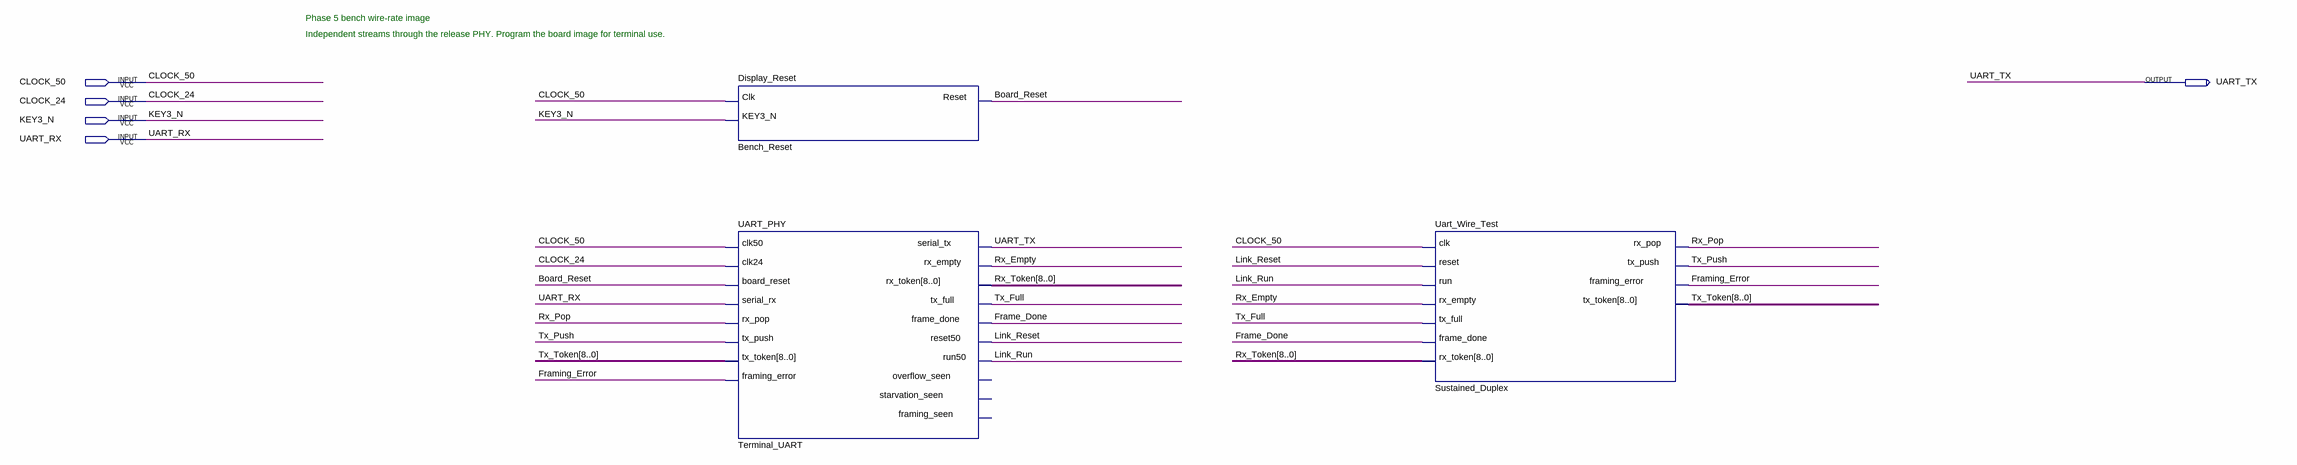
[diagram p0: schematic sheet]
// Quartus schematic Phase5_Wire_Test.bdf as structural Verilog: 3 symbols, 5 pins
module Phase5_Wire_Test (
  input  CLOCK_50,
  input  CLOCK_24,
  input  KEY3_N,
  input  UART_RX,
  output UART_TX
);

  wire Board_Reset, Frame_Done, Framing_Error, Link_Reset, Link_Run, Rx_Empty, Rx_Pop, Tx_Full, Tx_Push;
  wire [8:0] Rx_Token, Tx_Token;

  Display_Reset Bench_Reset (.Clk(CLOCK_50), .KEY3_N(KEY3_N), .Reset(Board_Reset));
  UART_PHY Terminal_UART (
    .clk50(CLOCK_50), .clk24(CLOCK_24), .board_reset(Board_Reset), .serial_rx(UART_RX), .rx_pop(Rx_Pop),
    .tx_push(Tx_Push), .tx_token(Tx_Token), .framing_error(Framing_Error), .serial_tx(UART_TX),
    .rx_empty(Rx_Empty), .rx_token(Rx_Token), .tx_full(Tx_Full), .frame_done(Frame_Done),
    .reset50(Link_Reset), .run50(Link_Run));  // open: overflow_seen, starvation_seen, framing_seen
  Uart_Wire_Test Sustained_Duplex (
    .clk(CLOCK_50), .reset(Link_Reset), .run(Link_Run), .rx_empty(Rx_Empty), .tx_full(Tx_Full),
    .frame_done(Frame_Done), .rx_token(Rx_Token), .rx_pop(Rx_Pop), .tx_push(Tx_Push),
    .framing_error(Framing_Error), .tx_token(Tx_Token));

  // Notes on the sheet:
  //   Phase 5 bench wire-rate image
  //   Independent streams through the release PHY. Program the board image for terminal use.
endmodule
